# Altium schematic sheet Connector_Sheet_2.SchDoc
size A4
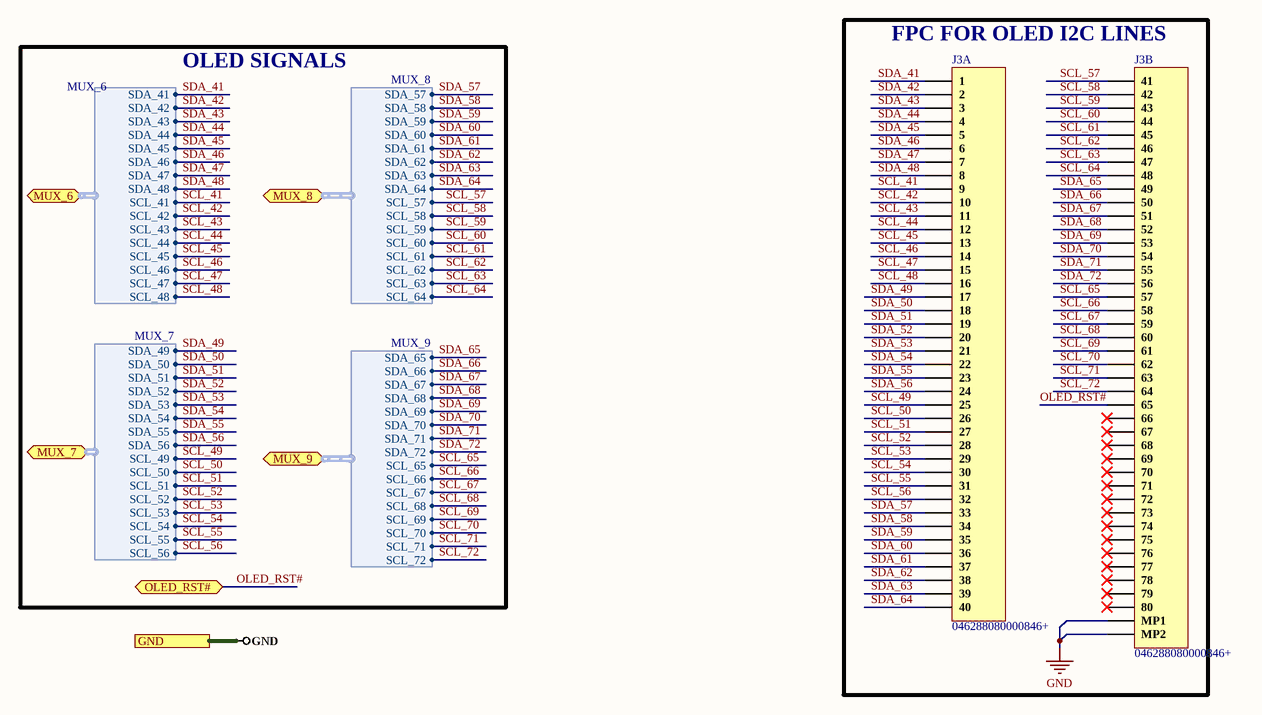
[diagram p0: Connector_Sheet_2.SchDoc]

## Parts
J3  046288080000846+  [046288080000846+]  (parts A,B of 2)

## Blocks framed on the sheet
FPC FOR OLED I2C LINES: J3

## Ports
GND, MUX_6 (bidir, harness MUX_6), MUX_7 (bidir, harness MUX_7), MUX_8 (bidir, harness MUX_8), MUX_9 (bidir, harness MUX_9), OLED_RST# (bidir)

## Harnesses
MUX_8: SDA_57, SDA_58, SDA_59, SDA_60, SDA_61, SDA_62, SDA_63, SDA_64, SCL_57, SCL_58, SCL_59, SCL_60, SCL_61, SCL_62, SCL_63, SCL_64
MUX_9: SDA_65, SDA_66, SDA_67, SDA_68, SDA_69, SDA_70, SDA_71, SDA_72, SCL_65, SCL_66, SCL_67, SCL_68, SCL_69, SCL_70, SCL_71, SCL_72
MUX_7: SDA_49, SDA_50, SDA_51, SDA_52, SDA_53, SDA_54, SDA_55, SDA_56, SCL_49, SCL_50, SCL_51, SCL_52, SCL_53, SCL_54, SCL_55, SCL_56
MUX_6: SDA_41, SDA_42, SDA_43, SDA_44, SDA_45, SDA_46, SDA_47, SDA_48, SCL_41, SCL_42, SCL_43, SCL_44, SCL_45, SCL_46, SCL_47, SCL_48

## Nets
GND: J3.MP1 J3.MP2 ; port GND
OLED_RST#: J3.65 ; port OLED_RST#
SCL_41: J3.9 ; port MUX_6.SCL_41
SCL_42: J3.10 ; port MUX_6.SCL_42
SCL_43: J3.11 ; port MUX_6.SCL_43
SCL_44: J3.12 ; port MUX_6.SCL_44
SCL_45: J3.13 ; port MUX_6.SCL_45
SCL_46: J3.14 ; port MUX_6.SCL_46
SCL_47: J3.15 ; port MUX_6.SCL_47
SCL_48: J3.16 ; port MUX_6.SCL_48
SCL_49: J3.25 ; port MUX_7.SCL_49
SCL_50: J3.26 ; port MUX_7.SCL_50
SCL_51: J3.27 ; port MUX_7.SCL_51
SCL_52: J3.28 ; port MUX_7.SCL_52
SCL_53: J3.29 ; port MUX_7.SCL_53
SCL_54: J3.30 ; port MUX_7.SCL_54
SCL_55: J3.31 ; port MUX_7.SCL_55
SCL_56: J3.32 ; port MUX_7.SCL_56
SCL_57: J3.41 ; port MUX_8.SCL_57
SCL_58: J3.42 ; port MUX_8.SCL_58
SCL_59: J3.43 ; port MUX_8.SCL_59
SCL_60: J3.44 ; port MUX_8.SCL_60
SCL_61: J3.45 ; port MUX_8.SCL_61
SCL_62: J3.46 ; port MUX_8.SCL_62
SCL_63: J3.47 ; port MUX_8.SCL_63
SCL_64: J3.48 ; port MUX_8.SCL_64
SCL_65: J3.57 ; port MUX_9.SCL_65
SCL_66: J3.58 ; port MUX_9.SCL_66
SCL_67: J3.59 ; port MUX_9.SCL_67
SCL_68: J3.60 ; port MUX_9.SCL_68
SCL_69: J3.61 ; port MUX_9.SCL_69
SCL_70: J3.62 ; port MUX_9.SCL_70
SCL_71: J3.63 ; port MUX_9.SCL_71
SCL_72: J3.64 ; port MUX_9.SCL_72
SDA_41: J3.1 ; port MUX_6.SDA_41
SDA_42: J3.2 ; port MUX_6.SDA_42
SDA_43: J3.3 ; port MUX_6.SDA_43
SDA_44: J3.4 ; port MUX_6.SDA_44
SDA_45: J3.5 ; port MUX_6.SDA_45
SDA_46: J3.6 ; port MUX_6.SDA_46
SDA_47: J3.7 ; port MUX_6.SDA_47
SDA_48: J3.8 ; port MUX_6.SDA_48
SDA_49: J3.17 ; port MUX_7.SDA_49
SDA_50: J3.18 ; port MUX_7.SDA_50
SDA_51: J3.19 ; port MUX_7.SDA_51
SDA_52: J3.20 ; port MUX_7.SDA_52
SDA_53: J3.21 ; port MUX_7.SDA_53
SDA_54: J3.22 ; port MUX_7.SDA_54
SDA_55: J3.23 ; port MUX_7.SDA_55
SDA_56: J3.24 ; port MUX_7.SDA_56
SDA_57: J3.33 ; port MUX_8.SDA_57
SDA_58: J3.34 ; port MUX_8.SDA_58
SDA_59: J3.35 ; port MUX_8.SDA_59
SDA_60: J3.36 ; port MUX_8.SDA_60
SDA_61: J3.37 ; port MUX_8.SDA_61
SDA_62: J3.38 ; port MUX_8.SDA_62
SDA_63: J3.39 ; port MUX_8.SDA_63
SDA_64: J3.40 ; port MUX_8.SDA_64
SDA_65: J3.49 ; port MUX_9.SDA_65
SDA_66: J3.50 ; port MUX_9.SDA_66
SDA_67: J3.51 ; port MUX_9.SDA_67
SDA_68: J3.52 ; port MUX_9.SDA_68
SDA_69: J3.53 ; port MUX_9.SDA_69
SDA_70: J3.54 ; port MUX_9.SDA_70
SDA_71: J3.55 ; port MUX_9.SDA_71
SDA_72: J3.56 ; port MUX_9.SDA_72

Not connected (* = marked no-connect by the designer): J3 66* 67* 68* 69* 70* 71* 72* 73* 74* 75* 76* 77* 78* 79* 80*

## Notes on the sheet
- OLED SIGNALS
- 1
- Huzaifa Ali

## Library data of the parts
J3 = 046288080000846+: 0.5MM PITCH - 80 POS - RIGHT ANG; Manufacturer: Kyocera AVX; ComponentLink1Description: LCSC; ComponentLink1URL: https://lcsc.com/product-detail/FFC-span-style-background-color-ff0-FPC-span-Connectors_Kyocera-046288080000846_C513346.html; Manufacturer Part Number: 046288080000846+; Footprint: Custom